# Altium schematic sheet IOExpand.SchDoc
size Letter; SheetNumber: 14; SheetTotal: 15
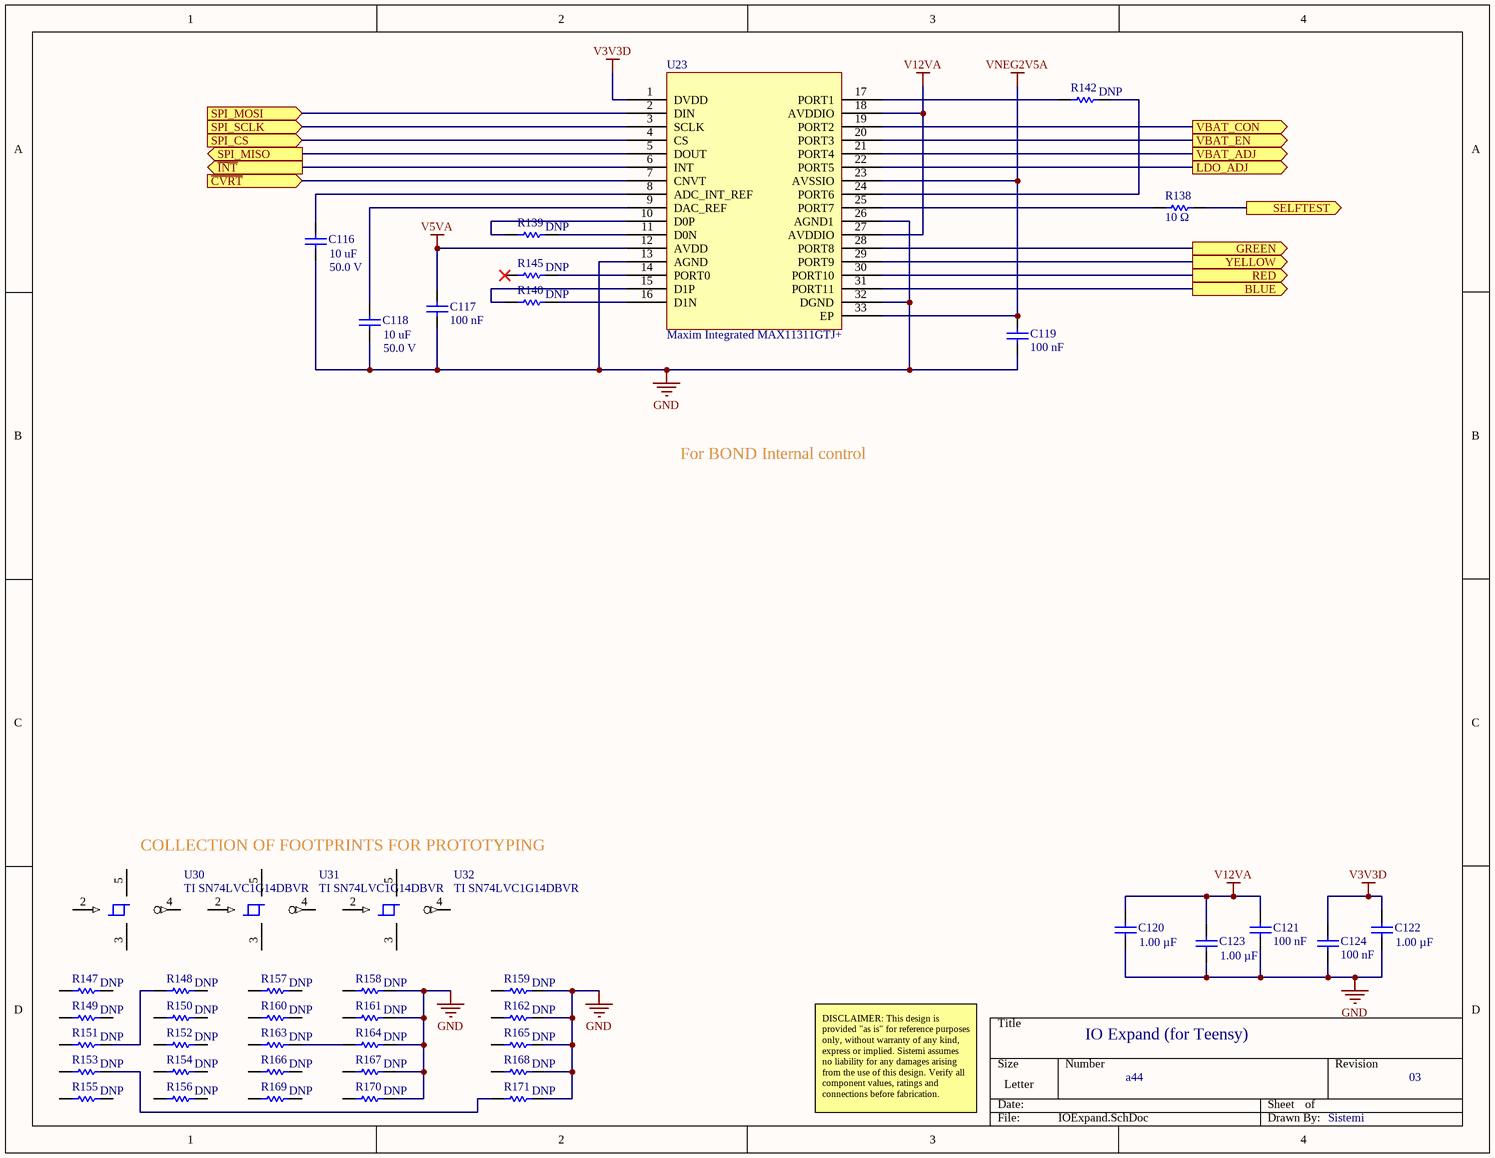
[diagram p0: IOExpand.SchDoc]

## Parts
C116  Capacitance: 10 uF  Voltage Rating (DC): 50.0 V  [CAPC3216X180X55LL20T25]  (hidden comment: Murata GRM31CR61H106KA12L)
C117  Capacitance: 100 nF  [CAPC1005X56X25NL10T15]  (hidden comment: Samsung CL05B104KO5NNNC)
C118  Capacitance: 10 uF  Voltage Rating (DC): 50.0 V  [CAPC3216X180X55LL20T25]  (hidden comment: Murata GRM31CR61H106KA12L)
C119  Capacitance: 100 nF  [CAPC1005X56X25NL10T15]  (hidden comment: Samsung CL05B104KO5NNNC)
C120  Capacitance: 1.00 µF  [CAPC1608X90X35NL15T15]  (hidden comment: Samsung CL10B105KA8NNNC)
C121  Capacitance: 100 nF  [CAPC1005X56X25NL10T15]  (hidden comment: Samsung CL05B104KO5NNNC)
C122  Capacitance: 1.00 µF  [CAPC1608X90X35NL15T15]  (hidden comment: Samsung CL10B105KA8NNNC)
C123  Capacitance: 1.00 µF  [CAPC1608X90X35NL15T15]  (hidden comment: Samsung CL10B105KA8NNNC)
C124  Capacitance: 100 nF  [CAPC1005X56X25NL10T15]  (hidden comment: Samsung CL05B104KO5NNNC)
R138  Resistance: 10 Ω  [RESC1005X40X25NL05T05]  (hidden comment: 10 Ω,±1%,0402)
R139  Resistance: DNP  [RESC1608X55X30ML15T15]  (hidden comment: Generic RES 0603)
R140  Resistance: DNP  [RESC1608X55X30ML15T15]  (hidden comment: Generic RES 0603)
R142  Resistance: DNP  [RESC1608X55X30ML15T15]  (hidden comment: Generic RES 0603)
R145  Resistance: DNP  [RESC1608X55X30ML15T15]  (hidden comment: Generic RES 0603)
R147  Resistance: DNP  [RESC1608X55X30ML15T15]  (hidden comment: Generic RES 0603)
R148  Resistance: DNP  [RESC1608X55X30ML15T15]  (hidden comment: Generic RES 0603)
R149  Resistance: DNP  [RESC1608X55X30ML15T15]  (hidden comment: Generic RES 0603)
R150  Resistance: DNP  [RESC1608X55X30ML15T15]  (hidden comment: Generic RES 0603)
R151  Resistance: DNP  [RESC1608X55X30ML15T15]  (hidden comment: Generic RES 0603)
R152  Resistance: DNP  [RESC1608X55X30ML15T15]  (hidden comment: Generic RES 0603)
R153  Resistance: DNP  [RESC1608X55X30ML15T15]  (hidden comment: Generic RES 0603)
R154  Resistance: DNP  [RESC1608X55X30ML15T15]  (hidden comment: Generic RES 0603)
R155  Resistance: DNP  [RESC1608X55X30ML15T15]  (hidden comment: Generic RES 0603)
R156  Resistance: DNP  [RESC1608X55X30ML15T15]  (hidden comment: Generic RES 0603)
R157  Resistance: DNP  [RESC1608X55X30ML15T15]  (hidden comment: Generic RES 0603)
R158  Resistance: DNP  [RESC1608X55X30ML15T15]  (hidden comment: Generic RES 0603)
R159  Resistance: DNP  [RESC1608X55X30ML15T15]  (hidden comment: Generic RES 0603)
R160  Resistance: DNP  [RESC1608X55X30ML15T15]  (hidden comment: Generic RES 0603)
R161  Resistance: DNP  [RESC1608X55X30ML15T15]  (hidden comment: Generic RES 0603)
R162  Resistance: DNP  [RESC1608X55X30ML15T15]  (hidden comment: Generic RES 0603)
R163  Resistance: DNP  [RESC1608X55X30ML15T15]  (hidden comment: Generic RES 0603)
R164  Resistance: DNP  [RESC1608X55X30ML15T15]  (hidden comment: Generic RES 0603)
R165  Resistance: DNP  [RESC1608X55X30ML15T15]  (hidden comment: Generic RES 0603)
R166  Resistance: DNP  [RESC1608X55X30ML15T15]  (hidden comment: Generic RES 0603)
R167  Resistance: DNP  [RESC1608X55X30ML15T15]  (hidden comment: Generic RES 0603)
R168  Resistance: DNP  [RESC1608X55X30ML15T15]  (hidden comment: Generic RES 0603)
R169  Resistance: DNP  [RESC1608X55X30ML15T15]  (hidden comment: Generic RES 0603)
R170  Resistance: DNP  [RESC1608X55X30ML15T15]  (hidden comment: Generic RES 0603)
R171  Resistance: DNP  [RESC1608X55X30ML15T15]  (hidden comment: Generic RES 0603)
U23  Maxim Integrated MAX11311GTJ+  [PCB-s1hzzxkmij8s4b201del-1]
U30  TI SN74LVC1G14DBVR  [TI-DBV5_M]
U31  TI SN74LVC1G14DBVR  [TI-DBV5_M]
U32  TI SN74LVC1G14DBVR  [TI-DBV5_M]

## Ports
BLUE (out), GREEN (out), LDO_ADJ (out), RED (out), SELFTEST (out), SPI_CS (in), SPI_MISO (out), SPI_MOSI (in), SPI_SCLK (in), VBAT_ADJ (out), VBAT_CON (out), VBAT_EN (out), YELLOW (out), ~{CVRT} (in), ~{INT} (out)

## Nets
GND: C116.1 C117.2 C118.1 C119.2 C120.1 C121.2 C122.1 C123.1 C124.2 R158.1 R159.1 R161.1 R162.1 R164.1 R165.1 R167.1 R168.1 R170.1 R171.1 U23.13(AGND) U23.26(AGND1) U23.32(DGND)
V3V3D: C122.2 C124.1 U23.1(DVDD)
V5VA: C117.1 U23.12(AVDD)
V12VA: C120.2 C121.1 C123.2 U23.18(AVDDIO) U23.27(AVDDIO)
VNEG2V5A: C119.1 U23.23(AVSSIO) U23.33(EP)
BLUE: U23.31(PORT11) ; port BLUE
~{CVRT}: U23.7(CNVT) ; port ~{CVRT}
GREEN: U23.28(PORT8) ; port GREEN
~{INT}: U23.6(INT) ; port ~{INT}
LDO_ADJ: U23.22(PORT5) ; port LDO_ADJ
RED: U23.30(PORT10) ; port RED
SELFTEST: R138.1 ; port SELFTEST
SPI_CS: U23.4(CS) ; port SPI_CS
SPI_MISO: U23.5(DOUT) ; port SPI_MISO
SPI_MOSI: U23.2(DIN) ; port SPI_MOSI
SPI_SCLK: U23.3(SCLK) ; port SPI_SCLK
VBAT_ADJ: U23.21(PORT4) ; port VBAT_ADJ
VBAT_CON: U23.19(PORT2) ; port VBAT_CON
VBAT_EN: U23.20(PORT3) ; port VBAT_EN
YELLOW: U23.29(PORT9) ; port YELLOW
NetC116_2: C116.2 U23.8(ADC_INT_REF)
NetC118_2: C118.2 U23.9(DAC_REF)
NetR138_2: R138.2 U23.25(PORT7)
NetR139_1: R139.1 U23.11(D0N)
NetR139_2: R139.2 U23.10(D0P)
NetR140_1: R140.1 U23.16(D1N)
NetR140_2: R140.2 U23.15(D1P)
NetR142_1: R142.1 U23.24(PORT6)
NetR142_2: R142.2 U23.17(PORT1)
NetR145_1: R145.1 U23.14(PORT0)
NetR148_2: R148.2 R151.1
NetR153_1: R153.1 R171.2
NetR163_1: R163.1 R164.2

Not connected (* = marked no-connect by the designer): R145 2*; R147 1 2; R148 1; R149 1 2; R150 1 2; R151 2; R152 1 2; R153 2; R154 1 2; R155 1 2; R156 1 2; R157 1 2; R158 2; R159 2; R160 1 2; R161 2; R162 2; R163 2; R165 2; R166 1 2; R167 2; R168 2; R169 1 2; R170 2; U30 2(A) 3 4(Y) 5; U31 2(A) 3 4(Y) 5; U32 2(A) 3 4(Y) 5

## Notes on the sheet
- For BOND Internal control
- COLLECTION OF FOOTPRINTS FOR PROTOTYPING
- IO Expand (for Teensy)
- DISCLAIMER: This design is provided "as is" for reference purposes only, without warranty of any kind, express or implied. Sistemi assumes no liability for any damages arising from the use of this design. Verify all component values, ratings and connections before fabrication.
- a44
- 03
- Sistemi

## Library data of the parts
C116 C118 = CMP-3554908-2: Multilayer Ceramic Capacitors MLCC - SMD/SMT 1206 10uF 50volt X5R +/-10%; Manufacturer Part Number: CL31B106KBHNNNE; Capacitance Tolerance: ±10%; Case/Package (SI): 3216; Lead-Free Status: Lead Free; Dielectric Characteristic: X5R; Lifecycle Status: Active; Mounting Style: Surface Mount; Number of Pins: 2; Octopart Url: https://octopart.com/grm31cr61h106ka12l-murata-18903335; OctopartID: fd8535afa9c42242; Packaging: Cut Tape (CT); REACH SVHC Compliance: No SVHC; RoHS: Compliant; Size-Length: 0.0032 m; Size-Thickness: 0.0016 m; Size-Width: 0.0016 m
C117 C119 C121 C124 = CMP-bf2276a55d9a60e5-19: Ceramic capacitor SMD-0402 100nF /16V X7R# K +-10%, Samsung, RoHS; Dielectric Characteristic: X7R; Lead-Free Status: Lead Free; Voltage Rating (DC): 16.0 V; Capacitance Tolerance: ±10%; Mounting Style: Surface Mount; Case/Package: 0402; OctopartID: 0755ced2c795d892; Footprint: PCB-0002-00476-3; Octopart URL: https://octopart.com/cl05b104ko5nnnc-samsung-9299366; RoHS: Compliant; Manufacturer Part Number: CL05B104KO5NNNC
C120 C122 C123 = CMP-7473528-5: CL Series 0603 1 uF 25 V ±10 % X7R Surface Mount Multilayer Ceramic Capacitor; Manufacturer Part Number: UMK107AB7105KA-T; Lead-Free Status: Lead Free; Capacitance Tolerance: ±10%; Voltage Rating (DC): 25.0 V; RoHS: Compliant; Mounting Style: Surface Mount; Footprint: PCB-0002-00062-3; Octopart URL: http://octopart.com/cl10b105ka8nnnc-samsung-19831597; Case/Package: 0603; OctopartID: ce7a065e703111bd; Dielectric Characteristic: X7R
R138 = CMP-3902036-3: Generic RES 0402, =Resistance+','+Tolerance+','+Case; Manufacturer Part Number: RT0402FRE0710RL; Lead-Free Status: Lead Free; Voltage: 50.0 V; Power: 0.063 W; Mounting Style: Surface Mount; RoHS: Compliant; Number of Pins: 2; Tolerance: ±1%; Octopart Url: TBD; Case: 0402; OctopartID: 26dced8948c2f91b
R139 R140 R142 R145 R147-R171 = CMP-0800c38b3cf2d7c7-3: Generic RES 0603, =Resistance+','+Tolerance+','+Case; Manufacturer Part Number: TBD; Case/Package (SI): 1608; Lead-Free Status: Lead Free; Power Rating: 63.0 mW; Voltage: 50V; ELV Compliant: Compliant; Tolerance: ±1%; Temperature Coefficient: -50.0 ppm/°C to 50.0 ppm/°C; Octopart URL: TBD; Number of Pins: 2; Mounting Style: Surface Mount; Packaging: Tape & Reel (TR); Lifecycle Status: Active; RoHS: Compliant; Case: 0603; Operating Temperature: -55.0 °C to 125 °C; REACH SVHC Compliance: No SVHC; Footprint: PCB-0002-00066-3; OctopartID: a8e96364fc37772e
U23 = CMP-2cd8e1e00624f31f-4: 12-channel 12-Bit ADC and 12-Bit DAC, Analog PIXI, 12-Port Programmable Mixed-Signal I/O; Channels: 12; Lead-Free Status: Lead Free; Sample Rate: 400 kHz; Range Options: 0 to 2.5V, ±5V, 0 to +10V, -10V; Supply Voltage (DC): 4.75 V (max), 5.25 V (min); Manufacturer Part Number: MAX11311GTJ+; Lifecycle Status: Not Listed by Manufacturer; Octopart URL: http://octopart.com/max11311gtj%2B-maxim+integrated-70389658; RoHS: Compliant; Number of Bits: 12; OctopartID: 2cd8e1e00624f31f; Package: TQFN-32; Resolution: 12-bit
U30-U32 = CMP-19354130-5: IC SCHMITT TRIG INV SOT-23-5; Lead-Free Status: Lead Free; Propagation Delay Max (tpd): 5e-09 s; Output Current: 0.032 A; Number of Bits: 1; Supply Voltage (DC): 5.0 V; Output Current Drive: -0.001 A; REACH SVHC Compliance: No SVHC; OctopartID: 3234fb390160edf3; RoHS: Compliant; Manufacturer Part Number: SN74LVC1G14DBVR; Footprint: PCC-0151-00548-1; Octopart Url: https://octopart.com/sn74lvc1g14dbvr-texas+instruments-464434; Number of Pins: 5; Mounting Style: Surface Mount; Number of Circuits: 1; Number of Gates: 1; Lifecycle Status: Active; Case/Package: SOT-23